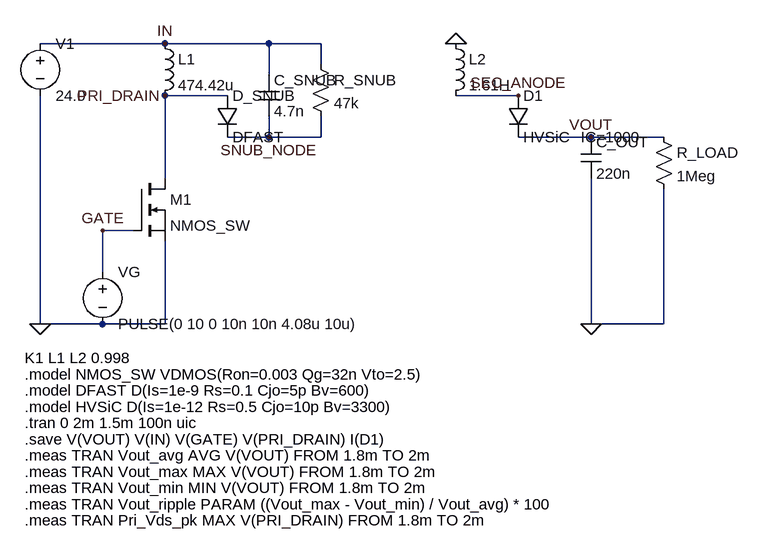
[diagram p0: schematic test_perfect_flyback.asc]
test_perfect_flyback.asc, the LTspice schematic file:
Version 4
SHEET 1 1200 680
WIRE 64 16 256 16
WIRE 256 16 416 16
WIRE 416 16 496 16
WIRE 64 96 64 448
WIRE 64 448 160 448
WIRE 160 448 256 448
WIRE 256 448 256 320
WIRE 160 368 160 304
WIRE 160 304 208 304
WIRE 256 96 256 224
WIRE 256 96 352 96
WIRE 416 16 416 64
WIRE 416 128 416 160
WIRE 496 16 496 48
WIRE 496 128 496 160
WIRE 352 160 416 160
WIRE 416 160 496 160
WIRE 704 96 800 96
WIRE 800 160 912 160
WIRE 912 160 1024 160
WIRE 912 224 912 448
WIRE 1024 240 1024 448
WIRE 912 448 1024 448
FLAG 64 448 0
FLAG 704 16 0
FLAG 912 448 0
FLAG 256 16 IN
FLAG 256 96 PRI_DRAIN
FLAG 160 304 GATE
FLAG 416 160 SNUB_NODE
FLAG 800 96 SEC_ANODE
FLAG 912 160 VOUT
SYMBOL voltage 64 0 R0
WINDOW 123 0 0 Left 2
WINDOW 39 0 0 Left 2
SYMATTR InstName V1
SYMATTR Value 24.0
SYMBOL voltage 160 352 R0
WINDOW 123 0 0 Left 2
WINDOW 39 0 0 Left 2
SYMATTR InstName VG
SYMATTR Value PULSE(0 10 0 10n 10n 4.08u 10u)
SYMBOL ind 240 0 R0
WINDOW 123 0 0 Left 2
WINDOW 39 0 0 Left 2
SYMATTR InstName L1
SYMATTR Value 474.42u
SYMBOL nmos 208 224 R0
WINDOW 123 0 0 Left 2
WINDOW 39 0 0 Left 2
SYMATTR InstName M1
SYMATTR Value NMOS_SW
SYMATTR Prefix M
SYMBOL diode 336 96 R0
WINDOW 123 0 0 Left 2
WINDOW 39 0 0 Left 2
SYMATTR InstName D_SNUB
SYMATTR Value DFAST
SYMBOL cap 400 64 R0
WINDOW 123 0 0 Left 2
WINDOW 39 0 0 Left 2
SYMATTR InstName C_SNUB
SYMATTR Value 4.7n
SYMBOL res 480 32 R0
WINDOW 123 0 0 Left 2
WINDOW 39 0 0 Left 2
SYMATTR InstName R_SNUB
SYMATTR Value 47k
SYMBOL ind 688 0 R0
WINDOW 123 0 0 Left 2
WINDOW 39 0 0 Left 2
SYMATTR InstName L2
SYMATTR Value 1.61H
SYMBOL diode 784 96 R0
WINDOW 123 0 0 Left 2
WINDOW 39 0 0 Left 2
SYMATTR InstName D1
SYMATTR Value HVSiC
SYMBOL cap 896 160 R0
WINDOW 123 0 0 Left 2
WINDOW 39 0 0 Left 2
SYMATTR InstName C_OUT
SYMATTR Value 220n
SYMATTR SpiceLine IC=1000
SYMBOL res 1008 144 R0
WINDOW 123 0 0 Left 2
WINDOW 39 0 0 Left 2
SYMATTR InstName R_LOAD
SYMATTR Value 1Meg
TEXT 40 500 Left 2 !K1 L1 L2 0.998
TEXT 40 525 Left 2 !.model NMOS_SW VDMOS(Ron=0.003 Qg=32n Vto=2.5)
TEXT 40 550 Left 2 !.model DFAST D(Is=1e-9 Rs=0.1 Cjo=5p Bv=600)
TEXT 40 575 Left 2 !.model HVSiC D(Is=1e-12 Rs=0.5 Cjo=10p Bv=3300)
TEXT 40 600 Left 2 !.tran 0 2m 1.5m 100n uic
TEXT 40 625 Left 2 !.save V(VOUT) V(IN) V(GATE) V(PRI_DRAIN) I(D1)
TEXT 40 650 Left 2 !.meas TRAN Vout_avg AVG V(VOUT) FROM 1.8m TO 2m
TEXT 40 675 Left 2 !.meas TRAN Vout_max MAX V(VOUT) FROM 1.8m TO 2m
TEXT 40 700 Left 2 !.meas TRAN Vout_min MIN V(VOUT) FROM 1.8m TO 2m
TEXT 40 725 Left 2 !.meas TRAN Vout_ripple PARAM ((Vout_max - Vout_min) / Vout_avg) * 100
TEXT 40 750 Left 2 !.meas TRAN Pri_Vds_pk MAX V(PRI_DRAIN) FROM 1.8m TO 2m

The netlist it stands for:
* test_perfect_flyback.asc
V1 IN 0 24.0
VG GATE 0 PULSE(0 10 0 10n 10n 4.08u 10u)
L1 IN PRI_DRAIN 474.42u
M1 PRI_DRAIN GATE 0 0 NMOS_SW
D_SNUB PRI_DRAIN SNUB_NODE DFAST
C_SNUB IN SNUB_NODE 4.7n
R_SNUB IN SNUB_NODE 47k
L2 0 SEC_ANODE 1.61H
D1 SEC_ANODE VOUT HVSiC
C_OUT VOUT 0 220n IC=1000
R_LOAD VOUT 0 1Meg
.model D D
.lib standard.dio
.model NMOS NMOS
.model PMOS PMOS
.lib standard.mos
K1 L1 L2 0.998
.model NMOS_SW VDMOS(Ron=0.003 Qg=32n Vto=2.5)
.model DFAST D(Is=1e-9 Rs=0.1 Cjo=5p Bv=600)
.model HVSiC D(Is=1e-12 Rs=0.5 Cjo=10p Bv=3300)
.tran 0 2m 1.5m 100n uic
.save V(VOUT) V(IN) V(GATE) V(PRI_DRAIN) I(D1)
.meas TRAN Vout_avg AVG V(VOUT) FROM 1.8m TO 2m
.meas TRAN Vout_max MAX V(VOUT) FROM 1.8m TO 2m
.meas TRAN Vout_min MIN V(VOUT) FROM 1.8m TO 2m
.meas TRAN Vout_ripple PARAM ((Vout_max - Vout_min) / Vout_avg) * 100
.meas TRAN Pri_Vds_pk MAX V(PRI_DRAIN) FROM 1.8m TO 2m
.backanno
.end